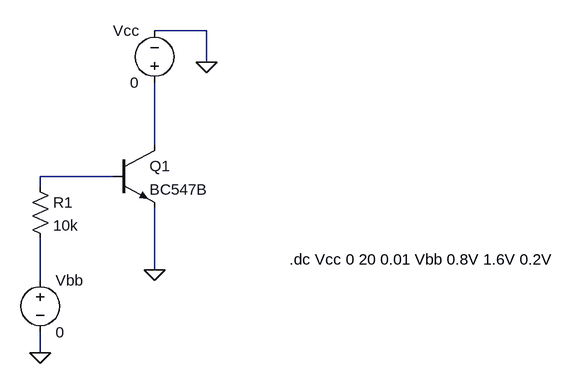
[diagram p0: schematic Draft1.asc]
Draft1.asc, the LTspice schematic file:
Version 4.1
SHEET 1 880 680
WIRE 160 -192 80 -192
WIRE 160 -144 160 -192
WIRE 80 -16 80 -112
WIRE 16 32 -96 32
WIRE -96 48 -96 32
WIRE 80 176 80 80
WIRE -96 192 -96 128
WIRE -96 304 -96 272
FLAG -96 304 0
FLAG 80 176 0
FLAG 160 -144 0
SYMBOL npn 16 -16 R0
SYMATTR InstName Q1
SYMATTR Value BC547B
SYMBOL res -112 32 R0
SYMATTR InstName R1
SYMATTR Value 10k
SYMBOL voltage -96 176 R0
WINDOW 123 0 0 Left 0
WINDOW 39 0 0 Left 0
SYMATTR InstName Vbb
SYMATTR Value 0
SYMBOL voltage 80 -96 R180
WINDOW 0 24 96 Left 2
WINDOW 3 24 16 Left 2
WINDOW 123 0 0 Left 0
WINDOW 39 0 0 Left 0
SYMATTR InstName Vcc
SYMATTR Value 0
TEXT 288 160 Left 2 !.dc Vcc 0 20 0.01 Vbb 0.8V 1.6V 0.2V

The netlist it stands for:
* Draft1.asc
Q1 N001 N002 0 0 BC547B
R1 N002 N003 10k
Vbb N003 0 0
Vcc N001 0 0
.model NPN NPN
.model PNP PNP
.lib standard.bjt
.dc Vcc 0 20 0.01 Vbb 0.8V 1.6V 0.2V
.backanno
.end